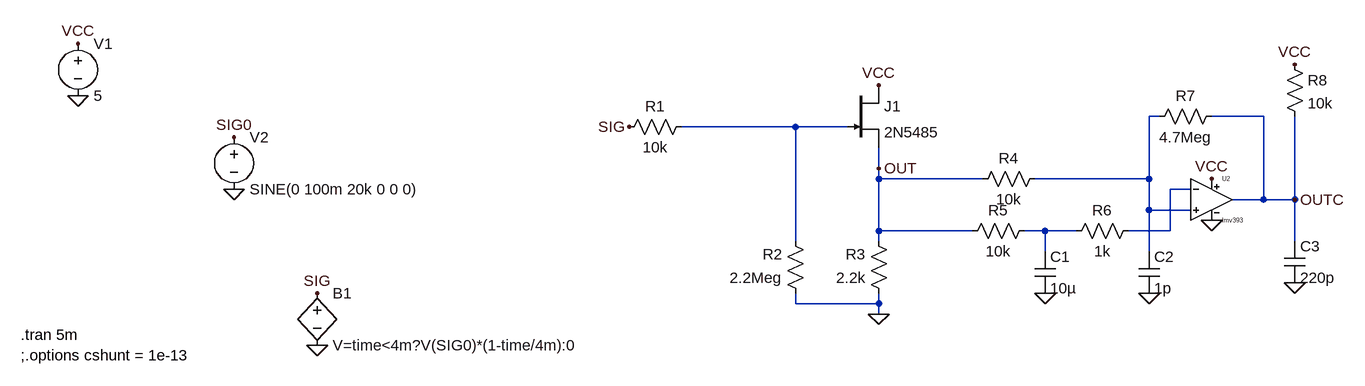
[diagram p0: schematic ring_tester2.asc]
ring_tester2.asc, the LTspice schematic file:
Version 4
SHEET 1 1440 680
WIRE 992 96 976 96
WIRE 1152 96 1072 96
WIRE 432 112 256 112
WIRE 512 112 432 112
WIRE 560 176 560 144
WIRE 560 192 560 176
WIRE 720 192 560 192
WIRE 976 192 976 96
WIRE 976 192 800 192
WIRE 1040 208 1008 208
WIRE 1152 224 1152 96
WIRE 1152 224 1104 224
WIRE 1200 224 1200 96
WIRE 1200 224 1152 224
WIRE 976 240 976 192
WIRE 1040 240 976 240
WIRE 560 272 560 192
WIRE 704 272 560 272
WIRE 816 272 784 272
WIRE 864 272 816 272
WIRE 1008 272 1008 208
WIRE 1008 272 944 272
WIRE 432 288 432 112
WIRE 560 288 560 272
WIRE 1200 288 1200 224
WIRE 816 304 816 272
WIRE 976 304 976 240
WIRE 432 384 432 368
WIRE 560 384 560 368
WIRE 560 384 432 384
WIRE 560 400 560 384
FLAG 560 400 0
FLAG 560 48 VCC
FLAG -672 64 0
FLAG -672 -16 VCC
FLAG -432 208 0
FLAG -432 128 SIG0
FLAG 176 112 SIG
FLAG 560 176 OUT
FLAG 1072 256 0
FLAG 1072 192 VCC
FLAG 1200 16 VCC
FLAG 816 368 0
FLAG 1200 224 OUTC
FLAG -304 448 0
FLAG -304 368 SIG
FLAG 976 368 0
FLAG 1200 352 0
SYMBOL res 272 96 R90
WINDOW 0 0 56 VBottom 2
WINDOW 3 32 56 VTop 2
SYMATTR InstName R1
SYMATTR Value 10k
SYMBOL res 448 384 R180
WINDOW 0 36 76 Left 2
WINDOW 3 36 40 Left 2
SYMATTR InstName R2
SYMATTR Value 2.2Meg
SYMBOL res 576 384 R180
WINDOW 0 36 76 Left 2
WINDOW 3 36 40 Left 2
SYMATTR InstName R3
SYMATTR Value 2.2k
SYMBOL njf 512 48 R0
SYMATTR InstName J1
SYMATTR Value 2N5485
SYMBOL voltage -672 -32 R0
WINDOW 123 0 0 Left 0
WINDOW 39 0 0 Left 0
SYMATTR InstName V1
SYMATTR Value 5
SYMBOL voltage -432 112 R0
WINDOW 123 0 0 Left 0
WINDOW 39 0 0 Left 0
SYMATTR InstName V2
SYMATTR Value SINE(0 100m 20k 0 0 0)
SYMBOL res 816 176 R90
WINDOW 0 0 56 VBottom 2
WINDOW 3 32 56 VTop 2
SYMATTR InstName R4
SYMATTR Value 10k
SYMBOL res 800 256 R90
WINDOW 0 0 56 VBottom 2
WINDOW 3 32 56 VTop 2
SYMATTR InstName R5
SYMATTR Value 10k
SYMBOL res 960 256 R90
WINDOW 0 0 56 VBottom 2
WINDOW 3 32 56 VTop 2
SYMATTR InstName R6
SYMATTR Value 1k
SYMBOL cap 800 304 R0
SYMATTR InstName C1
SYMATTR Value 10µ
SYMBOL res 1088 80 R90
WINDOW 0 0 56 VBottom 2
WINDOW 3 32 56 VTop 2
SYMATTR InstName R7
SYMATTR Value 4.7Meg
SYMBOL res 1184 0 R0
SYMATTR InstName R8
SYMATTR Value 10k
SYMBOL bv -304 352 R0
SYMATTR InstName B1
SYMATTR Value V=time<4m?V(SIG0)*(1-time/4m):0
SYMBOL cap 960 304 R0
SYMATTR InstName C2
SYMATTR Value 1p
SYMBOL cap 1184 288 R0
SYMATTR InstName C3
SYMATTR Value 220p
SYMBOL LMV393 1072 160 R0
SYMATTR InstName U2
TEXT -760 432 Left 2 !.tran 5m\n;.options cshunt = 1e-13

The netlist it stands for:
* ring_tester2.asc
R1 N002 SIG 10k
R2 0 N002 2.2Meg
R3 0 OUT 2.2k
J1 VCC N002 OUT 2N5485
V1 VCC 0 5
V2 SIG0 0 SINE(0 100m 20k 0 0 0)
R4 N001 OUT 10k
R5 N004 OUT 10k
R6 N003 N004 1k
C1 N004 0 10µ
R7 OUTC N001 4.7Meg
R8 VCC OUTC 10k
B1 SIG 0 V=time<4m?V(SIG0)*(1-time/4m):0
C2 N001 0 1p
C3 OUTC 0 220p
XU2 N001 N003 VCC 0 OUTC lmv393  ; pins IN+ IN- Vcc GND OUT
.model NJF NJF
.model PJF PJF
.lib standard.jft
.tran 5m
;.options cshunt = 1e-13
.lib LMV393.sub
.backanno
.end